# Altium schematic sheet ISO_Single_Channel.SchDoc: =DocumentName
size A4; DocumentNumber: 1; Revision: 0; SheetNumber: 3; SheetTotal: 6
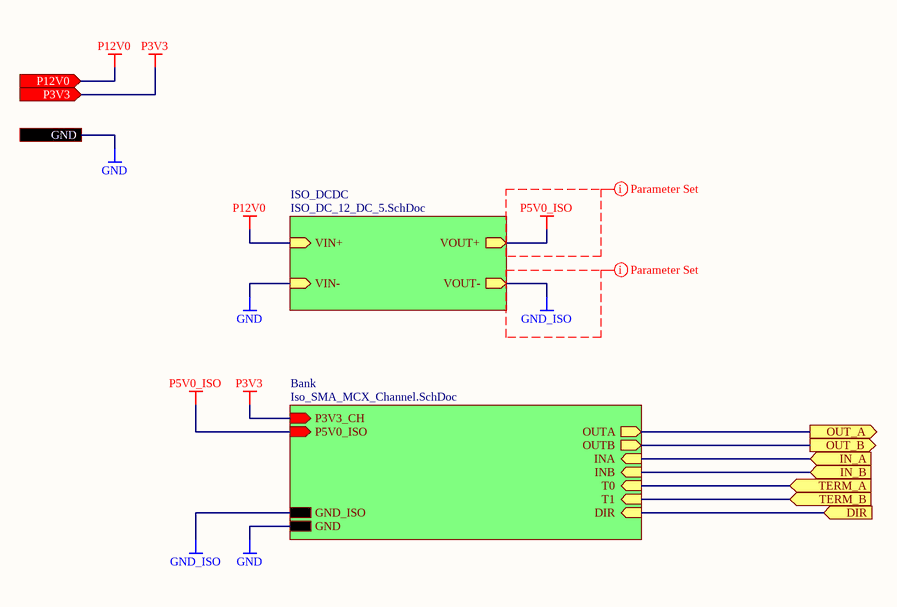
[diagram p0: ISO_Single_Channel.SchDoc]

## Sub-sheets
Bank = Iso_SMA_MCX_Channel.SchDoc: OUTA (out), OUTB (out), INA (in), INB (in), DIR (in), P3V3_CH (in), P5V0_ISO (in), GND_ISO, GND, T1 (in), T0 (in)
ISO_DCDC = ISO_DC_12_DC_5.SchDoc: VIN+ (in), VIN- (in), VOUT+ (out), VOUT- (out)

## Ports
DIR (in), GND, IN_A (in), IN_B (in), OUT_A (out), OUT_B (out), P3V3 (in), P12V0 (in), TERM_A (in), TERM_B (in)

## Nets
GND: port GND, sheet ISO_DCDC/VIN-, sheet Bank/GND
GND_ISO: sheet ISO_DCDC/VOUT-, sheet Bank/GND_ISO
P3V3: port P3V3, sheet Bank/P3V3_CH
P5V0_ISO: sheet ISO_DCDC/VOUT+, sheet Bank/P5V0_ISO
P12V0: port P12V0, sheet ISO_DCDC/VIN+
DIR: port DIR, sheet Bank/DIR
IN_A: port IN_A, sheet Bank/INA
IN_B: port IN_B, sheet Bank/INB
OUT_A: port OUT_A, sheet Bank/OUTA
OUT_B: port OUT_B, sheet Bank/OUTB
TERM_A: port TERM_A, sheet Bank/T0
TERM_B: port TERM_B, sheet Bank/T1

## Layout directives
net class GND_ISO: GND_ISO
net class PWR_ISO: P5V0_ISO

## Notes on the sheet
- Release
- Last modified =ModifiedDate
  Sheet =sheetnumber of =sheettotal · Size A4
- Copyright =P_copyright_owner
  This source describes Open Hardware and is licensed under the CERN-OHL-W v2. You may redistribute and modify this source and make products using it under the terms of the CERN-OHL-W v2 (https://cern.ch/cern-ohl). This source is distributed WITHOUT ANY EXPRESS OR IMPLIED WARRANTY, INCLUDING OF MERCHANTABILITY, SATISFACTORY QUALITY AND FITNESS FOR A PARTICULAR PURPOSE. Please see the CERN-OHL-W v2 for applicable conditions.
  Notice: If You produce hardware based on this source, You must maintain the Source Location visible on the product, its packaging or its documentation.
- SINARA OPEN HARDWARE
- OPEN HARDWARE FOR SCIENTIFIC INSTRUMENTATION
- https://github.com/sinara-hw
- Release owner
- Designers
- Reviewers
- Source location: